# Altium project Audio_Meter_V4.5.PrjPcb (part 1 of 5)
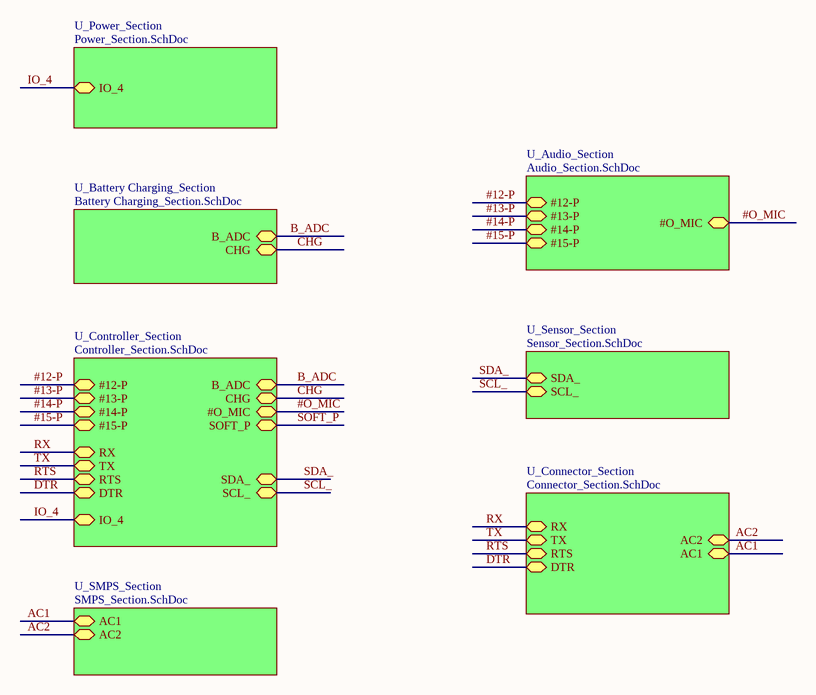
[diagram p0: Top_Sheet.SchDoc]
8 sheets, 109 parts. Net scope: hierarchical (ports join the sheet entries above them; power ports are global).
Board file: Audio_Meter_V4.5.PcbDoc
Sheets:
  Top_Sheet.SchDoc
    U_Controller_Section = Controller_Section.SchDoc
    U_Audio_Section = Audio_Section.SchDoc
    U_Connector_Section = Connector_Section.SchDoc
    U_Battery Charging_Section = Battery Charging_Section.SchDoc
    U_Power_Section = Power_Section.SchDoc
    U_Sensor_Section = Sensor_Section.SchDoc
    U_SMPS_Section = SMPS_Section.SchDoc

## Sheet Top_Sheet.SchDoc
size A; DocumentNumber: 1; SheetNumber: 1; SheetTotal: 8

### Sub-sheets
U_Audio_Section = Audio_Section.SchDoc: #O_MIC (bidir), #13-P (bidir), #14-P (bidir), #12-P (bidir), #15-P (bidir)
U_Battery Charging_Section = Battery Charging_Section.SchDoc: B_ADC (bidir), CHG (bidir)
U_Connector_Section = Connector_Section.SchDoc: TX (bidir), DTR (bidir), RTS (bidir), RX (bidir), AC2 (bidir), AC1 (bidir)
U_Controller_Section = Controller_Section.SchDoc: #15-P (bidir), #14-P (bidir), #12-P (bidir), #13-P (bidir), CHG (bidir), B_ADC (bidir), #O_MIC (bidir), SOFT_P (bidir), RTS (bidir), TX (bidir), DTR (bidir), RX (bidir), SDA_ (bidir), SCL_ (bidir), IO_4 (bidir)
U_Power_Section = Power_Section.SchDoc: IO_4 (bidir)
U_Sensor_Section = Sensor_Section.SchDoc: SDA_ (bidir), SCL_ (bidir)
U_SMPS_Section = SMPS_Section.SchDoc: AC1 (bidir), AC2 (bidir)

### Nets
#12-P: sheet U_Controller_Section/#12-P, sheet U_Audio_Section/#12-P
#13-P: sheet U_Controller_Section/#13-P, sheet U_Audio_Section/#13-P
#14-P: sheet U_Controller_Section/#14-P, sheet U_Audio_Section/#14-P
#15-P: sheet U_Controller_Section/#15-P, sheet U_Audio_Section/#15-P
#O_MIC: sheet U_Controller_Section/#O_MIC, sheet U_Audio_Section/#O_MIC
AC1: sheet U_Connector_Section/AC1, sheet U_SMPS_Section/AC1
AC2: sheet U_Connector_Section/AC2, sheet U_SMPS_Section/AC2
B_ADC: sheet U_Controller_Section/B_ADC, sheet U_Battery Charging_Section/B_ADC
CHG: sheet U_Controller_Section/CHG, sheet U_Battery Charging_Section/CHG
DTR: sheet U_Controller_Section/DTR, sheet U_Connector_Section/DTR
IO_4: sheet U_Controller_Section/IO_4, sheet U_Power_Section/IO_4
RTS: sheet U_Controller_Section/RTS, sheet U_Connector_Section/RTS
RX: sheet U_Controller_Section/RX, sheet U_Connector_Section/RX
SCL_: sheet U_Controller_Section/SCL_, sheet U_Sensor_Section/SCL_
SDA_: sheet U_Controller_Section/SDA_, sheet U_Sensor_Section/SDA_
TX: sheet U_Controller_Section/TX, sheet U_Connector_Section/TX

## Sheet Controller_Section.SchDoc
size A; DocumentNumber: 5; SheetNumber: 5; SheetTotal: 8
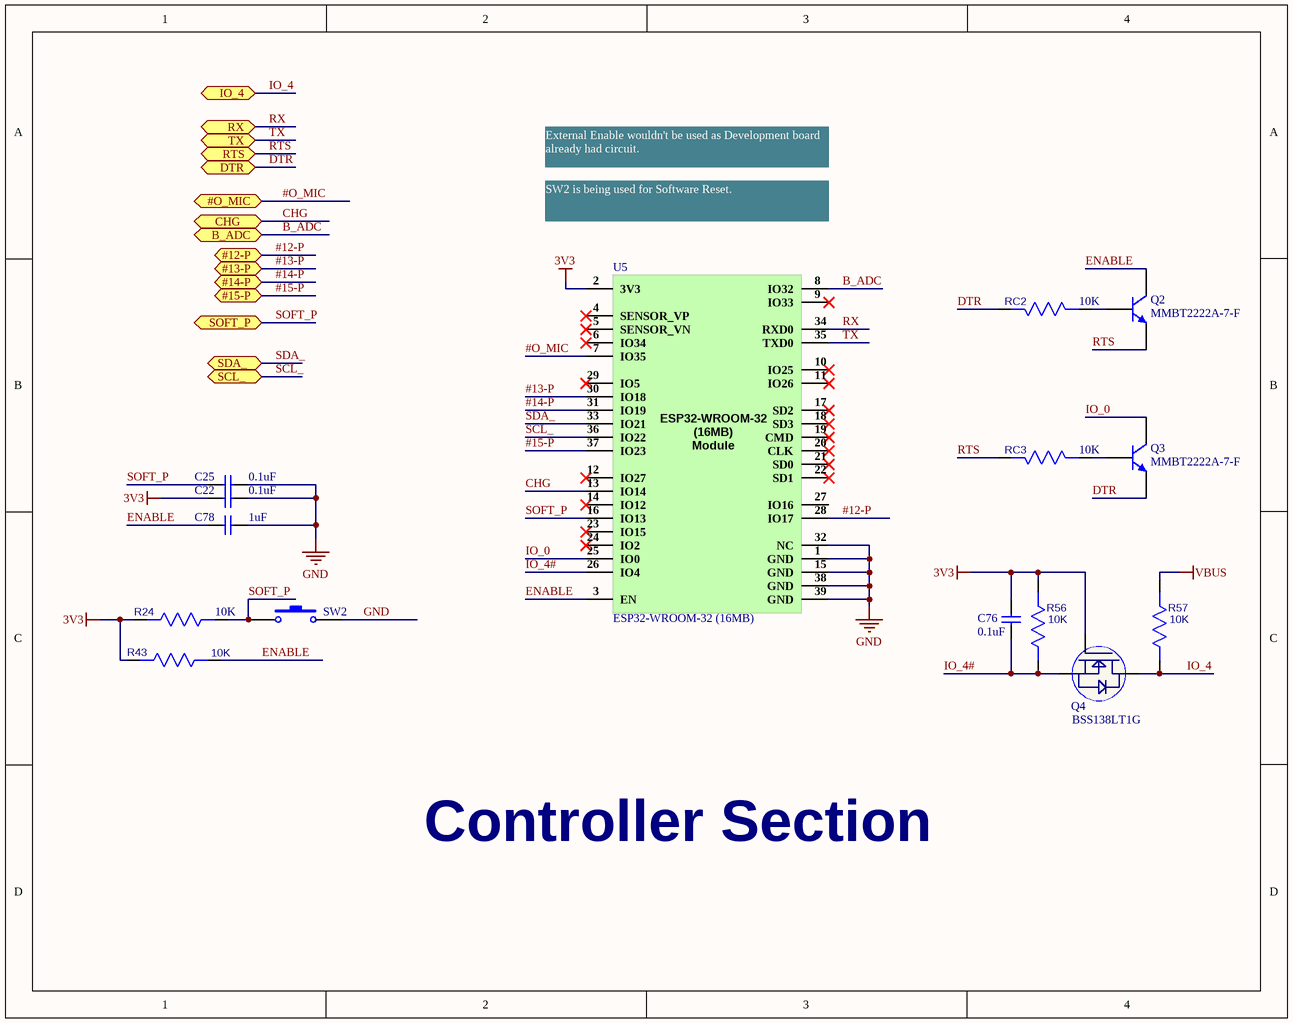
[diagram p1: Controller_Section.SchDoc]

### Parts
C22  0.1uF  [Cap0805]
C25  0.1uF  [Cap0805]
C76  0.1uF  [Cap0805]
C78  1uF  [Cap0805]
Q2  MMBT2222A-7-F  [SOT-23]
Q3  MMBT2222A-7-F  [SOT-23]
Q4  BSS138LT1G  [SOT-23]
R24  10K  [RES0805]
R43  10K  [RES0805]
R56  10K  [RES0805]
R57  10K  [RES0805]
RC2  10K  [RES0805]
RC3  10K  [RES0805]
SW2  Switch  [KSS221GLFS]  (value not drawn)
U5  ESP32-WROOM-32 (16MB)  [ESP32-WROOM-32 (16MB)]

### Ports
#12-P (bidir), #13-P (bidir), #14-P (bidir), #15-P (bidir), #O_MIC (bidir), B_ADC (bidir), CHG (bidir), DTR (bidir), IO_4 (bidir), RTS (bidir), RX (bidir), SCL_ (bidir), SDA_ (bidir), SOFT_P (bidir), TX (bidir)

### Nets
3V3: C22.1 C76.2 Q4.1(G) R24.2 R43.2 R56.1 U5.2(3V3)
GND: C22.2 C25.2 C78.2 SW2.2 U5.1(GND) U5.15(GND) U5.32(NC) U5.38(GND) U5.39(GND)
VBUS: R57.1
#12-P: U5.28(IO17) ; port #12-P
#13-P: U5.30(IO18) ; port #13-P
#14-P: U5.31(IO19) ; port #14-P
#15-P: U5.37(IO23) ; port #15-P
#O_MIC: U5.7(IO35) ; port #O_MIC
B_ADC: U5.8(IO32) ; port B_ADC
CHG: U5.13(IO14) ; port CHG
DTR: Q3.2(E) RC2.1 ; port DTR
ENABLE: C78.1 Q2.3(C) R43.1 U5.3(EN)
IO_0: Q3.3(C) U5.25(IO0)
IO_4: Q4.3(D) R57.2 ; port IO_4
IO_4#: C76.1 Q4.2(S) R56.2 U5.26(IO4)
RTS: Q2.2(E) RC3.1 ; port RTS
RX: U5.34(RXD0) ; port RX
SCL_: U5.36(IO22) ; port SCL_
SDA_: U5.33(IO21) ; port SDA_
SOFT_P: C25.1 R24.1 SW2.1 U5.16(IO13) ; port SOFT_P
TX: U5.35(TXD0) ; port TX
NetQ2_1: Q2.1(B) RC2.2
NetQ3_1: Q3.1(B) RC3.2

Not connected (* = marked no-connect by the designer): U5 4(SENSOR_VP)* 5(SENSOR_VN)* 6(IO34)* 9(IO33)* 10(IO25)* 11(IO26)* 12(IO27)* 14(IO12)* 17(SD2)* 18(SD3)* 19(CMD)* 20(CLK)* 21(SD0)* 22(SD1)* 23(IO15)* 24(IO2)* 27(IO16) 29(IO5)*

### Notes on the sheet
- External Enable wouldn't be used as Development board already had circuit.
- SW2 is being used for Software Reset.
- Controller Section
- (in symbol ESP32-WROOM-32 (16MB)) ESP32-WROOM-32 (16MB) Module

### Library data of the parts
C22 C25 C76 = CL21F104ZBCNNNC: CAP CER 0.1UF 50V Y5V 0805; Manufacturer: Samsung; Material: Ceramic; Capacitance: 100nF; Tolerance: 80%; Supplier 1: Digi-Key; Manufacturer Part Number: CL21F104ZBCNNNC; Stock 1: 4901061; Pricing 1: 1=0.1, 10=0.044, 100=0.0195, 500=0.0139, 1000=0.01092 (USD); Mount: Surface Mount; Case/Package: 0805; Case Code (Metric): 2012; Case Code (Imperial): 0805; Min Operating Temperature: -30°C; Max Operating Temperature: 85°C; Dielectric: Y5V; Packaging: Tape and Reel; Voltage Rating: 50V; Package Quantity: 1; Length: 2mm; Height: 0.85mm; Width: 0.049inch; Thickness: 0.037inch; Depth: 1.25mm; Radiation Hardening: No; ComponentLink1URL: https://media.digikey.com/pdf/Data%20Sheets/Samsung%20PDFs/CL_Series_MLCC_ds.pdf?src-supplier=Digi-Key; ComponentLink1Description: https://media.digikey.com/pdf/Data%20Sheets/Samsung%20PDFs/CL_Series_MLCC_ds.pdf?src-supplier=Digi-Key; Supplier Part Number 1: 1276-1007-6-ND
C78 = CL21B105KOFNNNG: CAP CER 1UF 16V X7R 0805; Manufacturer: Samsung; Material: Ceramic; Tolerance: 10%; Supplier 1: Digi-Key; Manufacturer Part Number: CL21B105KOFNNNG; Stock 1: 507348; Pricing 1: 1=0.1, 10=0.047, 100=0.0211, 500=0.01508, 1000=0.01185 (USD); Mount: Surface Mount; Case/Package: 0805; Case Code (Metric): 2012; Case Code (Imperial): 0805; Min Operating Temperature: -55°C; Max Operating Temperature: 125°C; Package Quantity: 3000; Packaging: Tape and Reel; Capacitance: 1uF; Voltage Rating: 16V; Dielectric: X7R; Voltage: 16V; Length: 2mm; Height: 1.25mm; Width: 0.049inch; Thickness: 0.053inch; Depth: 1.25mm; Lead Free: Lead Free; ComponentLink1URL: http://www.samsungsem.com/global/support/library/product-catalog/__icsFiles/afieldfile/2014/11/13/MLCC.pdf?src-supplier=Digi-Key; ComponentLink1Description: http://www.samsungsem.com/global/support/library/product-catalog/__icsFiles/afieldfile/2014/11/13/MLCC.pdf?src-supplier=Digi-Key; ComponentLink2URL: http://www1.futureelectronics.com/doc/SAMSUNG%20PASSIVE/CL05B104KQ5NNNC.pdf?src-supplier=Future+Electronics; ComponentLink2Description: http://www1.futureelectronics.com/doc/SAMSUNG%20PASSIVE/CL05B104KQ5NNNC.pdf?src-supplier=Future+Electronics; ComponentLink3URL: https://www.distrelec.biz/Web/Downloads/_e/ng/MLCC_CatalogDownload2013_ENG.pdf?mime=application%2Fpdf&src-supplier=Distrelec; ComponentLink3Description: https://www.distrelec.biz/Web/Downloads/_e/ng/MLCC_CatalogDownload2013_ENG.pdf?mime=application%2Fpdf&src-supplier=Distrelec; ComponentLink4URL: https://produktinfo.conrad.com/datenblaetter/450000-474999/455935-da-01-en-VS_KONDENSATOR_0805.pdf?src-supplier=Conrad; ComponentLink4Description: https://produktinfo.conrad.com/datenblaetter/450000-474999/455935-da-01-en-VS_KONDENSATOR_0805.pdf?src-supplier=Conrad; Supplier Part Number 1: 1276-6471-6-ND
Q2 Q3 = MMBT2222A-7-F: TRANS NPN 40V 0.6A SMD SOT23-3; Manufacturer: Diodes; Max Power Dissipation: 300mW; Collector Base Voltage (VCBO): 75V; Max Collector Current: 600mA; hFE Min: 100; Frequency: 300MHz; Number of Elements: 1; Emitter Base Voltage (VEBO): 6V; Collector Emitter Saturation Voltage: 1V; Power Dissipation: 350mW; Element Configuration: Single; Current: 1A; Supplier 1: Digi-Key; Manufacturer Part Number: MMBT2222A-7-F; Stock 1: 2471182; Pricing 1: 1=0.15, 10=0.134, 100=0.0729, 500=0.04486, 1000=0.03059 (USD); Mount: Surface Mount; Case/Package: SOT-23; Number of Pins: 3; Weight: 0.000282oz; Contact Plating: Matte,Tin; Min Operating Temperature: -55°C; Max Operating Temperature: 150°C; Packaging: Tape and Reel; Collector Emitter Voltage (VCEO): 40V; Polarity: NPN; Voltage Rating (DC): 40V; Package Quantity: 3000; Continuous Collector Current: 600mA; Collector Emitter Breakdown Voltage: 40V; Transition Frequency: 300MHz; Max Breakdown Voltage: 40V; Max Frequency: 300MHz; Termination: SMD/SMT; Gain Bandwidth Product: 300MHz; Current Rating: 600mA; Voltage: 40V; Length: 3.05mm; Height: 1mm; Width: 1.4mm; Radiation Hardening: No; Lead Free: Lead Free; REACH SVHC: No SVHC; ComponentLink1URL: http://www.diodes.com/datasheets/ds30041.pdf?src-supplier=Future+Electronics; ComponentLink1Description: http://www.diodes.com/datasheets/ds30041.pdf?src-supplier=Future+Electronics; ComponentLink2URL: http://www.diodes.com/datasheets/ds30041.pdf?src-supplier=Avnet; ComponentLink2Description: http://www.diodes.com/datasheets/ds30041.pdf?src-supplier=Avnet; ComponentLink3URL: https://www.verical.com/server-webapp/html/getDatasheet?partID=82692&src-supplier=Verical; ComponentLink3Description: https://www.verical.com/server-webapp/html/getDatasheet?partID=82692&src-supplier=Verical; ComponentLink4URL: https://www.diodes.com/assets/Datasheets/ds30041.pdf?src-supplier=Digi-Key; ComponentLink4Description: https://www.diodes.com/assets/Datasheets/ds30041.pdf?src-supplier=Digi-Key; ComponentLink5URL: http://www.diodes.com/datasheets/ds30041.pdf?src-supplier=Avnet+Europe; ComponentLink5Description: http://www.diodes.com/datasheets/ds30041.pdf?src-supplier=Avnet+Europe; ComponentLink6URL: http://www.diodes.com/datasheets/ds30041.pdf?src-supplier=Element14; ComponentLink6Description: http://www.diodes.com/datasheets/ds30041.pdf?src-supplier=Element14; Supplier Part Number 1: MMBT2222A-FDIDKR-ND
Q4 = BSS138LT1G: MOSFET N-CH 50V 200MA SOT-23; Manufacturer: ON Semiconductor; Gate to Source Voltage (Vgs): 20V; Nominal Vgs: 1.5V; Rds On Max: 3.5R; Input Capacitance: 50pF; Number of Elements: 1; Max Power Dissipation: 225mW; Turn-Off Delay Time: 20ns; Element Configuration: Single; ComponentLink1URL: https://datasheet.ciiva.com/22641/1596366-22641636.pdf; ComponentLink1Description: https://datasheet.ciiva.com/22641/1596366-22641636.pdf; ComponentLink2URL: https://datasheet.ciiva.com/1190/1596366-1190137.pdf; ComponentLink2Description: https://datasheet.ciiva.com/1190/1596366-1190137.pdf; ComponentLink3URL: https://datasheet.ciiva.com/15198/getdatasheetpartid-110266-15198908.pdf; ComponentLink3Description: https://datasheet.ciiva.com/15198/getdatasheetpartid-110266-15198908.pdf; ComponentLink4URL: https://datasheet.ciiva.com/8115/bss138lt1-d-8115295.pdf; ComponentLink4Description: https://datasheet.ciiva.com/8115/bss138lt1-d-8115295.pdf; ComponentLink5URL: https://datasheet.ciiva.com/8115/bss138lt1-d-8115358.pdf; ComponentLink5Description: https://datasheet.ciiva.com/8115/bss138lt1-d-8115358.pdf; ComponentLink6URL: https://datasheet.ciiva.com/1190/1596366-1190136.pdf; ComponentLink6Description: https://datasheet.ciiva.com/1190/1596366-1190136.pdf; ComponentLink7URL: https://datasheet.ciiva.com/936/bss138lt1-d-936802.pdf; ComponentLink7Description: https://datasheet.ciiva.com/936/bss138lt1-d-936802.pdf; ComponentLink8URL: https://datasheet.ciiva.com/936/bss138lt1-d-936801.pdf; ComponentLink8Description: https://datasheet.ciiva.com/936/bss138lt1-d-936801.pdf; ComponentLink9URL: https://datasheet.ciiva.com/14553/70099493-14553829.pdf; ComponentLink9Description: https://datasheet.ciiva.com/14553/70099493-14553829.pdf; ComponentLink10URL: https://datasheet.ciiva.com/936/bss138lt1-d-936803.pdf; ComponentLink10Description: https://datasheet.ciiva.com/936/bss138lt1-d-936803.pdf; Supplier 1: Digi-Key; Manufacturer Part Number: BSS138LT1G; Stock 1: 1283212; Pricing 1: 1=0.27, 10=0.222, 100=0.1177, 500=0.07746, 1000=0.05267 (USD); Case/Package: SOT-23-3; Number of Pins: 3; Contact Plating: Tin,Matte; Min Operating Temperature: -55°C; Max Operating Temperature: 150°C; Continuous Drain Current (ID): 200mA; Package Quantity: 1; Packaging: Tape and Reel; Drain to Source Breakdown Voltage: 50V; Power Dissipation: 225mW; Drain to Source Resistance: 3.5R; Threshold Voltage: 1.5V; Turn-On Delay Time: 20ns; Voltage Rating (DC): 50V; Current Rating: 200mA; On-State Resistance: 3.5R; Length: 3.04mm; Height: 1.01mm; Width: 1.4mm; Radiation Hardening: No; REACH SVHC: No SVHC; Lead Free: Lead Free; Halogen Free: Halogen Free; ComponentLink11URL: http://www.onsemi.com/pub/Collateral/BSS138LT1-D.PDF?src-supplier=Digi-Key; ComponentLink11Description: http://www.onsemi.com/pub/Collateral/BSS138LT1-D.PDF?src-supplier=Digi-Key; ComponentLink12URL: http://www.farnell.com/datasheets/1596366.pdf?src-supplier=Element14; ComponentLink12Description: http://www.farnell.com/datasheets/1596366.pdf?src-supplier=Element14; ComponentLink13URL: http://www.alliedelec.com/m/d/b3c6fd7d92596813fe75d33dcbaaae90.pdf?src-supplier=Allied+Electronics; ComponentLink13Description: http://www.alliedelec.com/m/d/b3c6fd7d92596813fe75d33dcbaaae90.pdf?src-supplier=Allied+Electronics; ComponentLink14URL: https://www.verical.com/server-webapp/html/getDatasheet?partID=110266&src-supplier=Verical; ComponentLink14Description: https://www.verical.com/server-webapp/html/getDatasheet?partID=110266&src-supplier=Verical; ComponentLink15URL: http://www.onsemi.com/pub_link/Collateral/BSS138LT1-D.PDF?src-supplier=Avnet; ComponentLink15Description: http://www.onsemi.com/pub_link/Collateral/BSS138LT1-D.PDF?src-supplier=Avnet; Supplier Part Number 1: BSS138LT1GOSDKR-ND
R24 RC2 RC3 = ERJ-P06J103V: RES SMD 10K OHM 5% 1/2W 0805; Manufacturer: Panasonic; Power Rating: 500mW; Voltage Rating: 400V; Temperature Coefficient: 200ppm/°C; Voltage Rating (DC): 150V; ComponentLink1URL: https://www.verical.com/server-webapp/html/getDatasheet?partID=409513; ComponentLink1Description: https://www.verical.com/server-webapp/html/getDatasheet?partID=409513; ComponentLink2URL: http://components.arrow.com/part/dataview/44988207S7163511N1174; ComponentLink2Description: http://components.arrow.com/part/dataview/44988207S7163511N1174; ComponentLink3URL: https://www.seielect.com/Catalog/SEI-RMCF_RMCP.pdf; ComponentLink3Description: https://www.seielect.com/Catalog/SEI-RMCF_RMCP.pdf; ComponentLink4URL: http://www.seielect.com/catalog/sei-rmc.pdf; ComponentLink4Description: http://www.seielect.com/catalog/sei-rmc.pdf; ComponentLink5URL: https://datasheet.ciiva.com/7777/424479-7777391.pdf; ComponentLink5Description: https://datasheet.ciiva.com/7777/424479-7777391.pdf; ComponentLink6URL: https://datasheet.ciiva.com/2581/crcwhpe3-2581488.pdf; ComponentLink6Description: https://datasheet.ciiva.com/2581/crcwhpe3-2581488.pdf; ComponentLink7URL: https://datasheet.ciiva.com/11808/0900766b80d98b26-11808546.pdf; ComponentLink7Description: https://datasheet.ciiva.com/11808/0900766b80d98b26-11808546.pdf; ComponentLink8URL: https://datasheet.ciiva.com/8934/dcrcwe3-8934585.pdf; ComponentLink8Description: https://datasheet.ciiva.com/8934/dcrcwe3-8934585.pdf; ComponentLink9URL: https://datasheet.ciiva.com/2467/dcrcwe3-2467241.pdf; ComponentLink9Description: https://datasheet.ciiva.com/2467/dcrcwe3-2467241.pdf; ComponentLink10URL: https://datasheet.ciiva.com/7777/1697337-7777401.pdf; ComponentLink10Description: https://datasheet.ciiva.com/7777/1697337-7777401.pdf; ComponentLink11URL: https://datasheet.ciiva.com/16852/dcrcwe3-16852347.pdf; ComponentLink11Description: https://datasheet.ciiva.com/16852/dcrcwe3-16852347.pdf; ComponentLink12URL: https://datasheet.ciiva.com/16200/dcrcwe3-16200123.pdf; ComponentLink12Description: https://datasheet.ciiva.com/16200/dcrcwe3-16200123.pdf; ComponentLink13URL: https://datasheet.ciiva.com/16725/70201119-16725227.pdf; ComponentLink13Description: https://datasheet.ciiva.com/16725/70201119-16725227.pdf; ComponentLink14URL: https://datasheet.ciiva.com/2467/dcrcwe3-2467239.pdf; ComponentLink14Description: https://datasheet.ciiva.com/2467/dcrcwe3-2467239.pdf; ComponentLink15URL: https://datasheet.ciiva.com/7777/1720486-7777575.pdf; ComponentLink15Description: https://datasheet.ciiva.com/7777/1720486-7777575.pdf; ComponentLink16URL: https://datasheet.ciiva.com/8934/dcrcwe3-8934581.pdf; ComponentLink16Description: https://datasheet.ciiva.com/8934/dcrcwe3-8934581.pdf; ComponentLink17URL: https://datasheet.ciiva.com/2467/dcrcwe3-2467240.pdf; ComponentLink17Description: https://datasheet.ciiva.com/2467/dcrcwe3-2467240.pdf; ComponentLink18URL: https://datasheet.ciiva.com/7777/1720486-7777576.pdf; ComponentLink18Description: https://datasheet.ciiva.com/7777/1720486-7777576.pdf; ComponentLink19URL: https://datasheet.ciiva.com/5546/dcrcwe3-109170-5546983.pdf; ComponentLink19Description: https://datasheet.ciiva.com/5546/dcrcwe3-109170-5546983.pdf; ComponentLink20URL: https://datasheet.ciiva.com/16755/70201119-16755757.pdf; ComponentLink20Description: https://datasheet.ciiva.com/16755/70201119-16755757.pdf; ComponentLink21URL: https://datasheet.ciiva.com/3258/dcrcwe3-3258221.pdf; ComponentLink21Description: https://datasheet.ciiva.com/3258/dcrcwe3-3258221.pdf; ComponentLink22URL: https://datasheet.ciiva.com/17204/dcrcwe3-17204398.pdf; ComponentLink22Description: https://datasheet.ciiva.com/17204/dcrcwe3-17204398.pdf; ComponentLink23URL: https://datasheet.ciiva.com/16435/dcrcwe3-16435934.pdf; ComponentLink23Description: https://datasheet.ciiva.com/16435/dcrcwe3-16435934.pdf; ComponentLink24URL: https://datasheet.ciiva.com/46441/1533075-46441628.pdf; ComponentLink24Description: https://datasheet.ciiva.com/46441/1533075-46441628.pdf; ComponentLink25URL: https://datasheet.ciiva.com/5544/dcrcwe3-109170-5544649.pdf; ComponentLink25Description: https://datasheet.ciiva.com/5544/dcrcwe3-109170-5544649.pdf; ComponentLink26URL: https://datasheet.ciiva.com/8337/dcrcwe3-8337669.pdf; ComponentLink26Description: https://datasheet.ciiva.com/8337/dcrcwe3-8337669.pdf; ComponentLink27URL: https://datasheet.ciiva.com/2463/dcrcwe3-2463179.pdf; ComponentLink27Description: https://datasheet.ciiva.com/2463/dcrcwe3-2463179.pdf; ComponentLink28URL: https://datasheet.ciiva.com/2463/dcrcwe3-2463178.pdf; ComponentLink28Description: https://datasheet.ciiva.com/2463/dcrcwe3-2463178.pdf; ComponentLink29URL: https://datasheet.ciiva.com/2474/crcwhpe3-2474640.pdf; ComponentLink29Description: https://datasheet.ciiva.com/2474/crcwhpe3-2474640.pdf; ComponentLink30URL: https://datasheet.ciiva.com/48527/crcwhpe3-48527638.pdf; ComponentLink30Description: https://datasheet.ciiva.com/48527/crcwhpe3-48527638.pdf; ComponentLink31URL: https://datasheet.ciiva.com/5547/crcwhpe3-46056-5547896.pdf; ComponentLink31Description: https://datasheet.ciiva.com/5547/crcwhpe3-46056-5547896.pdf; ComponentLink32URL: https://datasheet.ciiva.com/9112/crcwhpe3-9112140.pdf; ComponentLink32Description: https://datasheet.ciiva.com/9112/crcwhpe3-9112140.pdf; ComponentLink33URL: https://datasheet.ciiva.com/2474/crcwhpe3-2474638.pdf; ComponentLink33Description: https://datasheet.ciiva.com/2474/crcwhpe3-2474638.pdf; ComponentLink34URL: https://datasheet.ciiva.com/2474/crcwhpe3-2474639.pdf; ComponentLink34Description: https://datasheet.ciiva.com/2474/crcwhpe3-2474639.pdf; Supplier 1: Digi-Key; Manufacturer Part Number: ERJ-P06J103V; Stock 1: 130484; Pricing 1: 1=0.11, 10=0.103, 100=0.0396, 1000=0.0174, 2500=0.0151 (USD); Mount: Surface Mount; Case/Package: 0805; Weight: 0.000194oz; Case Code (Metric): 2012; Case Code (Imperial): 0805; Contact Plating: Tin; Min Operating Temperature: -55°C; Max Operating Temperature: 155°C; Resistance: 10K; Tolerance: 5%; Packaging: Tape and Reel; Package Quantity: 1; Composition: Thick Film; Number of Terminations: 2; Termination: SMD/SMT; Military Standard: Not; Max Power Dissipation: 500mW; Features: Automotive AEC-Q200; Length: 2mm; Height: 0.6mm; Width: 0.049inch; Depth: 1.25mm; Radiation Hardening: No; REACH SVHC: Unknown; Lead Free: Lead Free; ComponentLink35URL: http://uk.rs-online.com/webdocs/12cb/0900766b812cb812.pdf?src-supplier=RSComponents; ComponentLink35Description: http://uk.rs-online.com/webdocs/12cb/0900766b812cb812.pdf?src-supplier=RSComponents; ComponentLink36URL: http://industrial.panasonic.com/www-data/pdf/AOA0000/AOA0000CE4.pdf?src-supplier=Avnet; ComponentLink36Description: http://industrial.panasonic.com/www-data/pdf/AOA0000/AOA0000CE4.pdf?src-supplier=Avnet; ComponentLink37URL: http://industrial.panasonic.com/www-data/pdf/AOA0000/AOA0000CE4.pdf?src-supplier=Future+Electronics; ComponentLink37Description: http://industrial.panasonic.com/www-data/pdf/AOA0000/AOA0000CE4.pdf?src-supplier=Future+Electronics; ComponentLink38URL: http://www.farnell.com/datasheets/2059624.pdf?src-supplier=Element14; ComponentLink38Description: http://www.farnell.com/datasheets/2059624.pdf?src-supplier=Element14; ComponentLink39URL: https://www.alliedelec.com/m/d/12e4be79354a6c30aae91f11e8182ea0.pdf?src-supplier=Allied+Electronics; ComponentLink39Description: https://www.alliedelec.com/m/d/12e4be79354a6c30aae91f11e8182ea0.pdf?src-supplier=Allied+Electronics; ComponentLink40URL: http://www.farnell.com/datasheets/2059624.pdf?src-supplier=Farnell; ComponentLink40Description: http://www.farnell.com/datasheets/2059624.pdf?src-supplier=Farnell; Supplier Part Number 1: P10KADCT-ND
R43 R56 R57 = ERJ-P06J103V: RES SMD 10K OHM 5% 1/2W 0805; Manufacturer: Panasonic; Resistance: 10kR; Power Rating: 500mW; Voltage Rating: 400V; Temperature Coefficient: 200ppm/°C; Voltage Rating (DC): 150V; ComponentLink1URL: https://www.verical.com/server-webapp/html/getDatasheet?partID=409513; ComponentLink1Description: https://www.verical.com/server-webapp/html/getDatasheet?partID=409513; ComponentLink2URL: http://components.arrow.com/part/dataview/44988207S7163511N1174; ComponentLink2Description: http://components.arrow.com/part/dataview/44988207S7163511N1174; ComponentLink3URL: https://www.seielect.com/Catalog/SEI-RMCF_RMCP.pdf; ComponentLink3Description: https://www.seielect.com/Catalog/SEI-RMCF_RMCP.pdf; ComponentLink4URL: http://www.seielect.com/catalog/sei-rmc.pdf; ComponentLink4Description: http://www.seielect.com/catalog/sei-rmc.pdf; ComponentLink5URL: https://datasheet.ciiva.com/7777/424479-7777391.pdf; ComponentLink5Description: https://datasheet.ciiva.com/7777/424479-7777391.pdf; ComponentLink6URL: https://datasheet.ciiva.com/2581/crcwhpe3-2581488.pdf; ComponentLink6Description: https://datasheet.ciiva.com/2581/crcwhpe3-2581488.pdf; ComponentLink7URL: https://datasheet.ciiva.com/11808/0900766b80d98b26-11808546.pdf; ComponentLink7Description: https://datasheet.ciiva.com/11808/0900766b80d98b26-11808546.pdf; ComponentLink8URL: https://datasheet.ciiva.com/8934/dcrcwe3-8934585.pdf; ComponentLink8Description: https://datasheet.ciiva.com/8934/dcrcwe3-8934585.pdf; ComponentLink9URL: https://datasheet.ciiva.com/2467/dcrcwe3-2467241.pdf; ComponentLink9Description: https://datasheet.ciiva.com/2467/dcrcwe3-2467241.pdf; ComponentLink10URL: https://datasheet.ciiva.com/7777/1697337-7777401.pdf; ComponentLink10Description: https://datasheet.ciiva.com/7777/1697337-7777401.pdf; ComponentLink11URL: https://datasheet.ciiva.com/16852/dcrcwe3-16852347.pdf; ComponentLink11Description: https://datasheet.ciiva.com/16852/dcrcwe3-16852347.pdf; ComponentLink12URL: https://datasheet.ciiva.com/16200/dcrcwe3-16200123.pdf; ComponentLink12Description: https://datasheet.ciiva.com/16200/dcrcwe3-16200123.pdf; ComponentLink13URL: https://datasheet.ciiva.com/16725/70201119-16725227.pdf; ComponentLink13Description: https://datasheet.ciiva.com/16725/70201119-16725227.pdf; ComponentLink14URL: https://datasheet.ciiva.com/2467/dcrcwe3-2467239.pdf; ComponentLink14Description: https://datasheet.ciiva.com/2467/dcrcwe3-2467239.pdf; ComponentLink15URL: https://datasheet.ciiva.com/7777/1720486-7777575.pdf; ComponentLink15Description: https://datasheet.ciiva.com/7777/1720486-7777575.pdf; ComponentLink16URL: https://datasheet.ciiva.com/8934/dcrcwe3-8934581.pdf; ComponentLink16Description: https://datasheet.ciiva.com/8934/dcrcwe3-8934581.pdf; ComponentLink17URL: https://datasheet.ciiva.com/2467/dcrcwe3-2467240.pdf; ComponentLink17Description: https://datasheet.ciiva.com/2467/dcrcwe3-2467240.pdf; ComponentLink18URL: https://datasheet.ciiva.com/7777/1720486-7777576.pdf; ComponentLink18Description: https://datasheet.ciiva.com/7777/1720486-7777576.pdf; ComponentLink19URL: https://datasheet.ciiva.com/5546/dcrcwe3-109170-5546983.pdf; ComponentLink19Description: https://datasheet.ciiva.com/5546/dcrcwe3-109170-5546983.pdf; ComponentLink20URL: https://datasheet.ciiva.com/16755/70201119-16755757.pdf; ComponentLink20Description: https://datasheet.ciiva.com/16755/70201119-16755757.pdf; ComponentLink21URL: https://datasheet.ciiva.com/3258/dcrcwe3-3258221.pdf; ComponentLink21Description: https://datasheet.ciiva.com/3258/dcrcwe3-3258221.pdf; ComponentLink22URL: https://datasheet.ciiva.com/17204/dcrcwe3-17204398.pdf; ComponentLink22Description: https://datasheet.ciiva.com/17204/dcrcwe3-17204398.pdf; ComponentLink23URL: https://datasheet.ciiva.com/16435/dcrcwe3-16435934.pdf; ComponentLink23Description: https://datasheet.ciiva.com/16435/dcrcwe3-16435934.pdf; ComponentLink24URL: https://datasheet.ciiva.com/46441/1533075-46441628.pdf; ComponentLink24Description: https://datasheet.ciiva.com/46441/1533075-46441628.pdf; ComponentLink25URL: https://datasheet.ciiva.com/5544/dcrcwe3-109170-5544649.pdf; ComponentLink25Description: https://datasheet.ciiva.com/5544/dcrcwe3-109170-5544649.pdf; ComponentLink26URL: https://datasheet.ciiva.com/8337/dcrcwe3-8337669.pdf; ComponentLink26Description: https://datasheet.ciiva.com/8337/dcrcwe3-8337669.pdf; ComponentLink27URL: https://datasheet.ciiva.com/2463/dcrcwe3-2463179.pdf; ComponentLink27Description: https://datasheet.ciiva.com/2463/dcrcwe3-2463179.pdf; ComponentLink28URL: https://datasheet.ciiva.com/2463/dcrcwe3-2463178.pdf; ComponentLink28Description: https://datasheet.ciiva.com/2463/dcrcwe3-2463178.pdf; ComponentLink29URL: https://datasheet.ciiva.com/2474/crcwhpe3-2474640.pdf; ComponentLink29Description: https://datasheet.ciiva.com/2474/crcwhpe3-2474640.pdf; ComponentLink30URL: https://datasheet.ciiva.com/48527/crcwhpe3-48527638.pdf; ComponentLink30Description: https://datasheet.ciiva.com/48527/crcwhpe3-48527638.pdf; ComponentLink31URL: https://datasheet.ciiva.com/5547/crcwhpe3-46056-5547896.pdf; ComponentLink31Description: https://datasheet.ciiva.com/5547/crcwhpe3-46056-5547896.pdf; ComponentLink32URL: https://datasheet.ciiva.com/9112/crcwhpe3-9112140.pdf; ComponentLink32Description: https://datasheet.ciiva.com/9112/crcwhpe3-9112140.pdf; ComponentLink33URL: https://datasheet.ciiva.com/2474/crcwhpe3-2474638.pdf; ComponentLink33Description: https://datasheet.ciiva.com/2474/crcwhpe3-2474638.pdf; ComponentLink34URL: https://datasheet.ciiva.com/2474/crcwhpe3-2474639.pdf; ComponentLink34Description: https://datasheet.ciiva.com/2474/crcwhpe3-2474639.pdf; Supplier 1: Digi-Key; Manufacturer Part Number: ERJ-P06J103V; Stock 1: 130484; Pricing 1: 1=0.11, 10=0.103, 100=0.0396, 1000=0.0174, 2500=0.0151 (USD); Mount: Surface Mount; Case/Package: 0805; Weight: 0.000194oz; Case Code (Metric): 2012; Case Code (Imperial): 0805; Contact Plating: Tin; Min Operating Temperature: -55°C; Max Operating Temperature: 155°C; Tolerance: 5%; Packaging: Tape and Reel; Package Quantity: 1; Composition: Thick Film; Number of Terminations: 2; Termination: SMD/SMT; Military Standard: Not; Max Power Dissipation: 500mW; Features: Automotive AEC-Q200; Length: 2mm; Height: 0.6mm; Width: 0.049inch; Depth: 1.25mm; Radiation Hardening: No; REACH SVHC: Unknown; Lead Free: Lead Free; ComponentLink35URL: http://uk.rs-online.com/webdocs/12cb/0900766b812cb812.pdf?src-supplier=RSComponents; ComponentLink35Description: http://uk.rs-online.com/webdocs/12cb/0900766b812cb812.pdf?src-supplier=RSComponents; ComponentLink36URL: http://industrial.panasonic.com/www-data/pdf/AOA0000/AOA0000CE4.pdf?src-supplier=Avnet; ComponentLink36Description: http://industrial.panasonic.com/www-data/pdf/AOA0000/AOA0000CE4.pdf?src-supplier=Avnet; ComponentLink37URL: http://industrial.panasonic.com/www-data/pdf/AOA0000/AOA0000CE4.pdf?src-supplier=Future+Electronics; ComponentLink37Description: http://industrial.panasonic.com/www-data/pdf/AOA0000/AOA0000CE4.pdf?src-supplier=Future+Electronics; ComponentLink38URL: http://www.farnell.com/datasheets/2059624.pdf?src-supplier=Element14; ComponentLink38Description: http://www.farnell.com/datasheets/2059624.pdf?src-supplier=Element14; ComponentLink39URL: https://www.alliedelec.com/m/d/12e4be79354a6c30aae91f11e8182ea0.pdf?src-supplier=Allied+Electronics; ComponentLink39Description: https://www.alliedelec.com/m/d/12e4be79354a6c30aae91f11e8182ea0.pdf?src-supplier=Allied+Electronics; ComponentLink40URL: http://www.farnell.com/datasheets/2059624.pdf?src-supplier=Farnell; ComponentLink40Description: http://www.farnell.com/datasheets/2059624.pdf?src-supplier=Farnell; Supplier Part Number 1: P10KADCT-ND
SW2 = KSS221GLFS: Tactile Switch SPST-NO Side Actuated Surface Mount, Right Angle; Manufacturer: ITT C&K; Mechanical Life: 100000Cycles; Throw Configuration: SPST; Operating Force: 2N; Max Current Rating: 50mA; Max Voltage Rating (DC): 32V; Contact Resistance: 100mR; Power Rating: 1W; Illumination Type: Non-Illuminated,Illuminated; Insulation Resistance: 1GR; Switch Travel: 0.3mm; Switch Function: Off-Mom; Actuator Length: 0.8mm; IP Rating: IP40; Supplier 1: Digi-Key; Manufacturer Part Number: KSS221GLFS; Stock 1: 17242; Pricing 1: 1=0.68, 10=0.655, 25=0.6424, 50=0.6182, 100=0.5334, 250=0.4849, 500=0.4607, 1000=0.3637 (USD); Mount: Surface Mount; Contact Material: Silver; Contact Plating: Silver; Min Operating Temperature: -40°C; Max Operating Temperature: 85°C; Termination: Gull Wing; Packaging: Tape and Reel; Package Quantity: 1; Contact Current Rating: 50mA; Current Rating: 50mA; Voltage Rating (DC): 32V; Orientation: Right Angle; Length: 4.5mm; Width: 7mm; Depth: 4.4mm; Radiation Hardening: No; REACH SVHC: No SVHC; Lead Free: Lead Free; ComponentLink1URL: https://datasheet.ciiva.com/26917/getdatasheetpartid-773364-26917575.pdf; ComponentLink1Description: https://datasheet.ciiva.com/26917/getdatasheetpartid-773364-26917575.pdf; ComponentLink2URL: https://datasheet.ciiva.com/30466/0900766b8129cd37-30466697.pdf; ComponentLink2Description: https://datasheet.ciiva.com/30466/0900766b8129cd37-30466697.pdf; ComponentLink3URL: https://datasheet.ciiva.com/16496/kss221g20lfs-16496166.pdf; ComponentLink3Description: https://datasheet.ciiva.com/16496/kss221g20lfs-16496166.pdf; ComponentLink4URL: https://datasheet.ciiva.com/18145/getdatasheetpartid-313005-18145235.pdf; ComponentLink4Description: https://datasheet.ciiva.com/18145/getdatasheetpartid-313005-18145235.pdf; ComponentLink5URL: https://datasheet.ciiva.com/16155/kss221glfs-ckcomponents-16155741.pdf; ComponentLink5Description: https://datasheet.ciiva.com/16155/kss221glfs-ckcomponents-16155741.pdf; ComponentLink6URL: https://datasheet.ciiva.com/5684/19445-5684460.pdf; ComponentLink6Description: https://datasheet.ciiva.com/5684/19445-5684460.pdf; ComponentLink7URL: https://datasheet.ciiva.com/2900/kss-2900345.pdf; ComponentLink7Description: https://datasheet.ciiva.com/2900/kss-2900345.pdf; ComponentLink8URL: https://datasheet.ciiva.com/2900/kss-2900343.pdf; ComponentLink8Description: https://datasheet.ciiva.com/2900/kss-2900343.pdf; ComponentLink9URL: https://datasheet.ciiva.com/7986/19445-7986997.pdf; ComponentLink9Description: https://datasheet.ciiva.com/7986/19445-7986997.pdf; ComponentLink10URL: https://datasheet.ciiva.com/2900/kss-2900344.pdf; ComponentLink10Description: https://datasheet.ciiva.com/2900/kss-2900344.pdf; Supplier Part Number 1: 401-1097-6-ND
U5 = ESP32-WROOM-32 (16MB): WIFI MODULE 128MBITS SPI FLASH; Manufacturer: Espressif Systems; Manufacturer Part Number: ESP32-WROOM-32D(16MB); Interface: I2C,SPI,GPIO,PWM,SDIO,UART; Frequency: 2.5GHz; Data Rate: 150Mbps; Sensitivity: -98dBm; Memory Size: 536KB; Supplier 1: Mouser; Stock 1: 3620; Pricing 1: 1=4.5, 5=4.5 (USD); Mount: Surface Mount; Case/Package: SMD/SMT; Min Operating Temperature: -40°C; Max Operating Temperature: 85°C; Packaging: Tape and Reel; ComponentLink1URL: https://www.espressif.com/sites/default/files/documentation/esp32-wroom-32d_esp32-wroom-32u_datasheet_en.pdf?src-supplier=Digi-Key; ComponentLink1Description: https://www.espressif.com/sites/default/files/documentation/esp32-wroom-32d_esp32-wroom-32u_datasheet_en.pdf?src-supplier=Digi-Key; Supplier Part Number 1: 356-ES32WROOM32D16MB